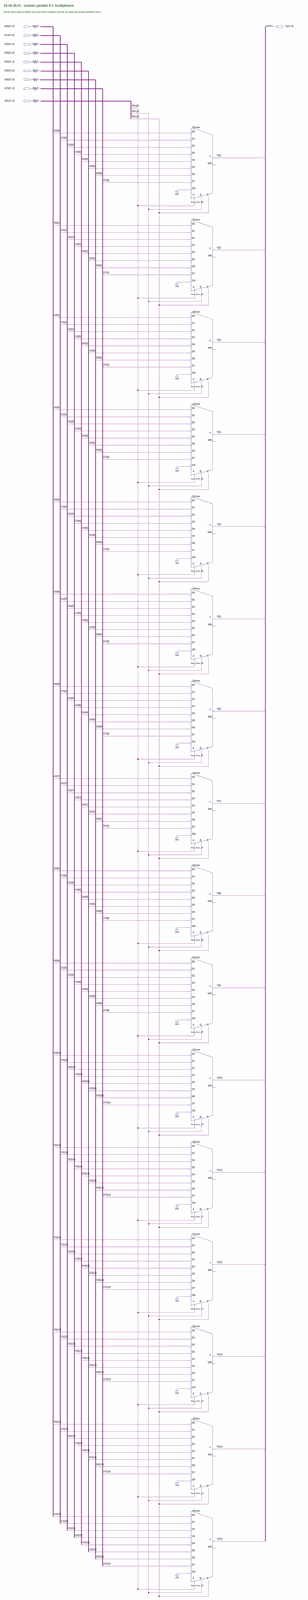
[diagram p0: schematic sheet, whole]
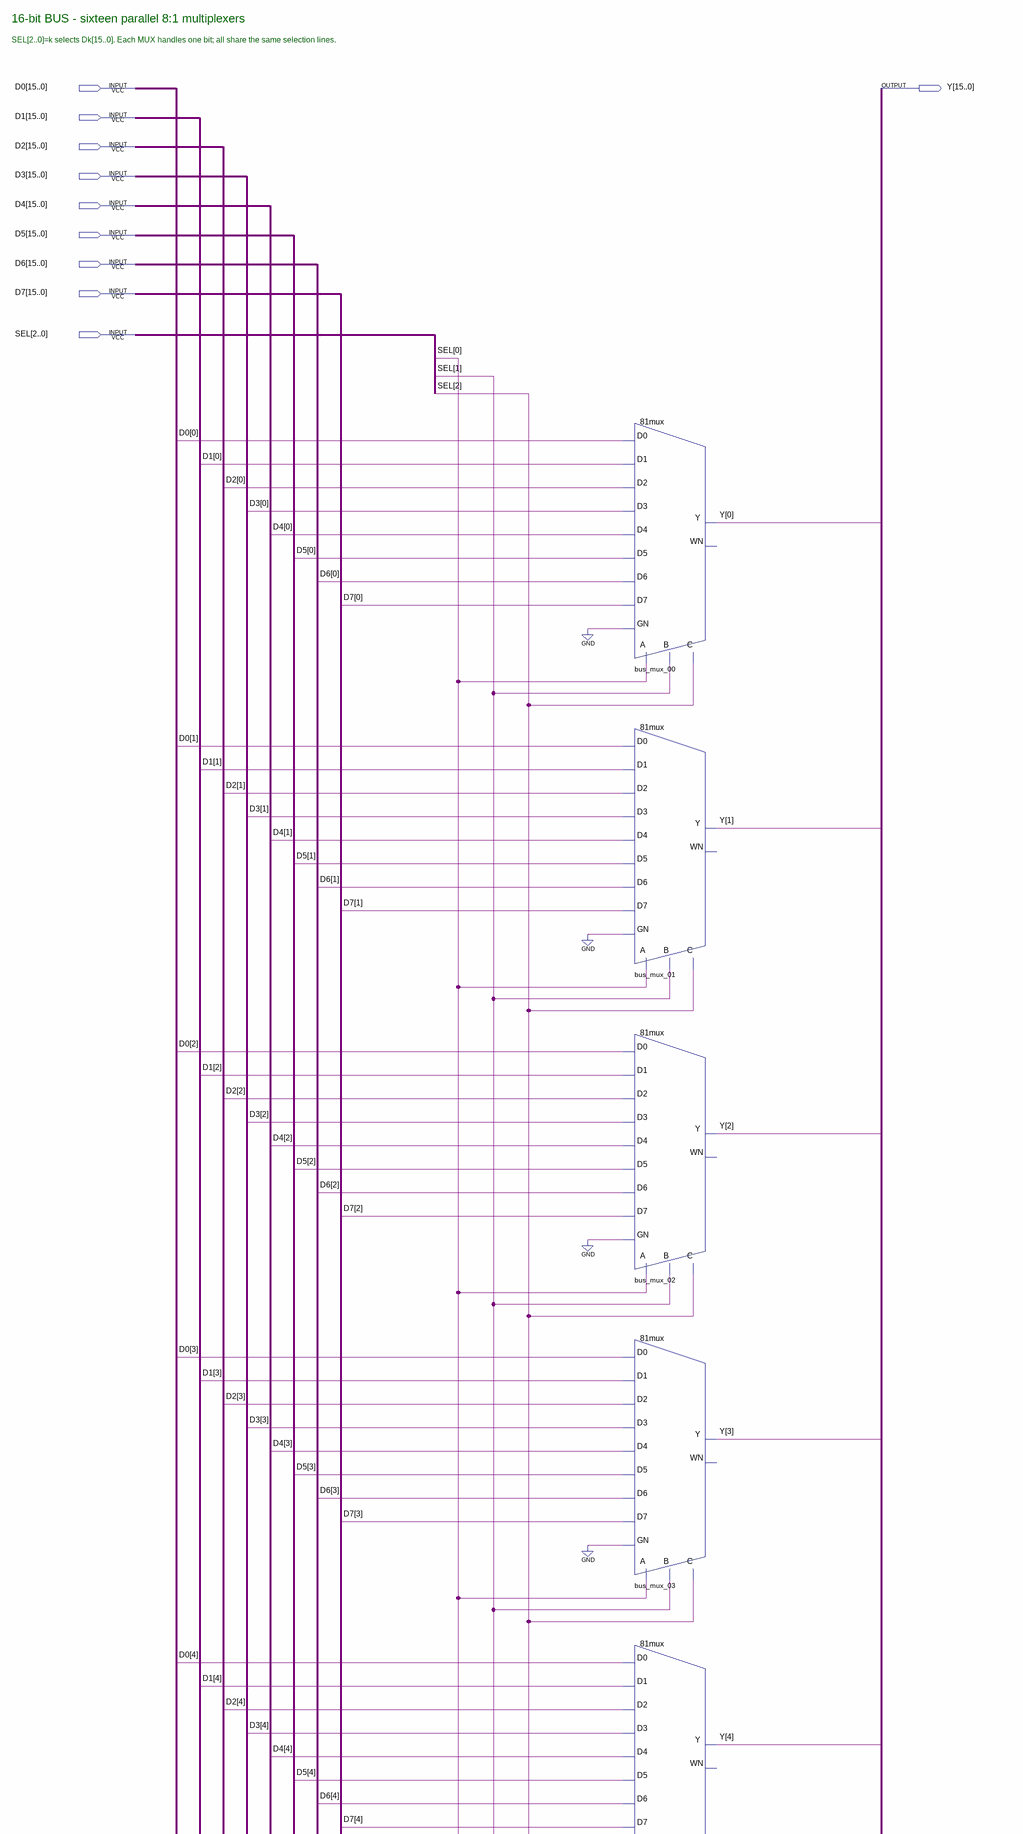
[diagram p1: schematic sheet, upper part]
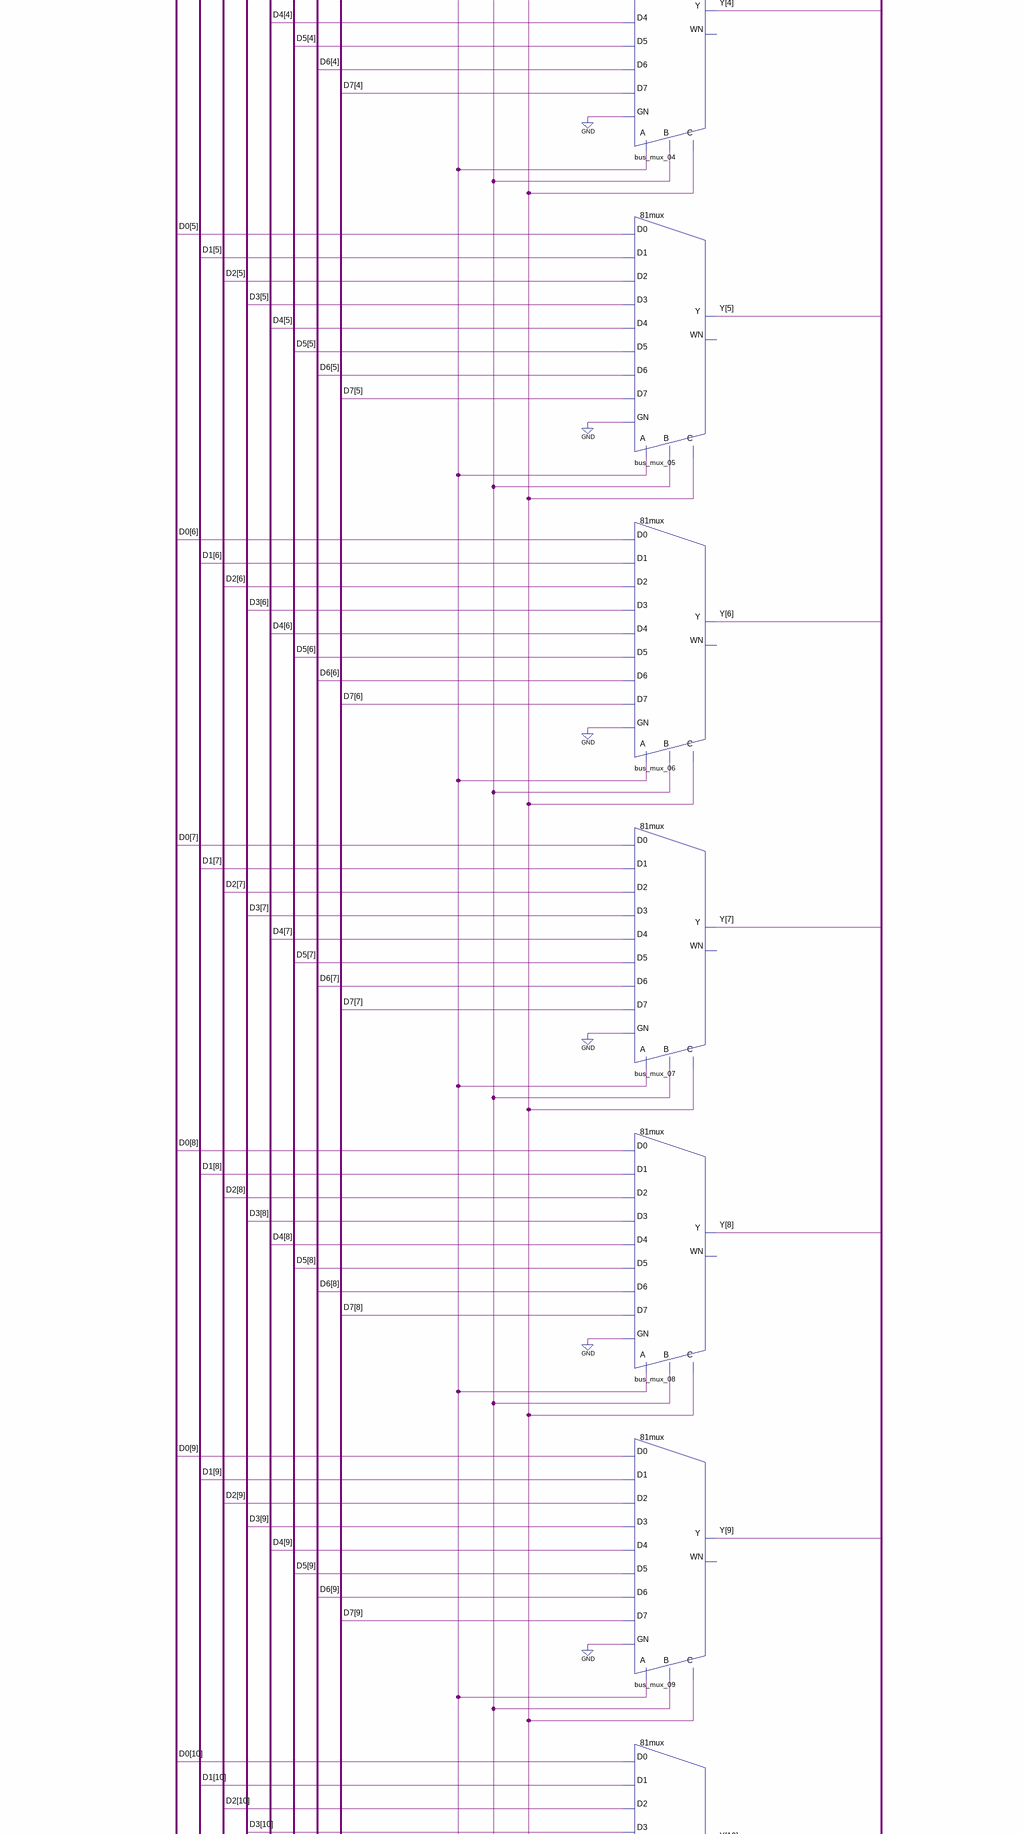
[diagram p2: schematic sheet, middle part]
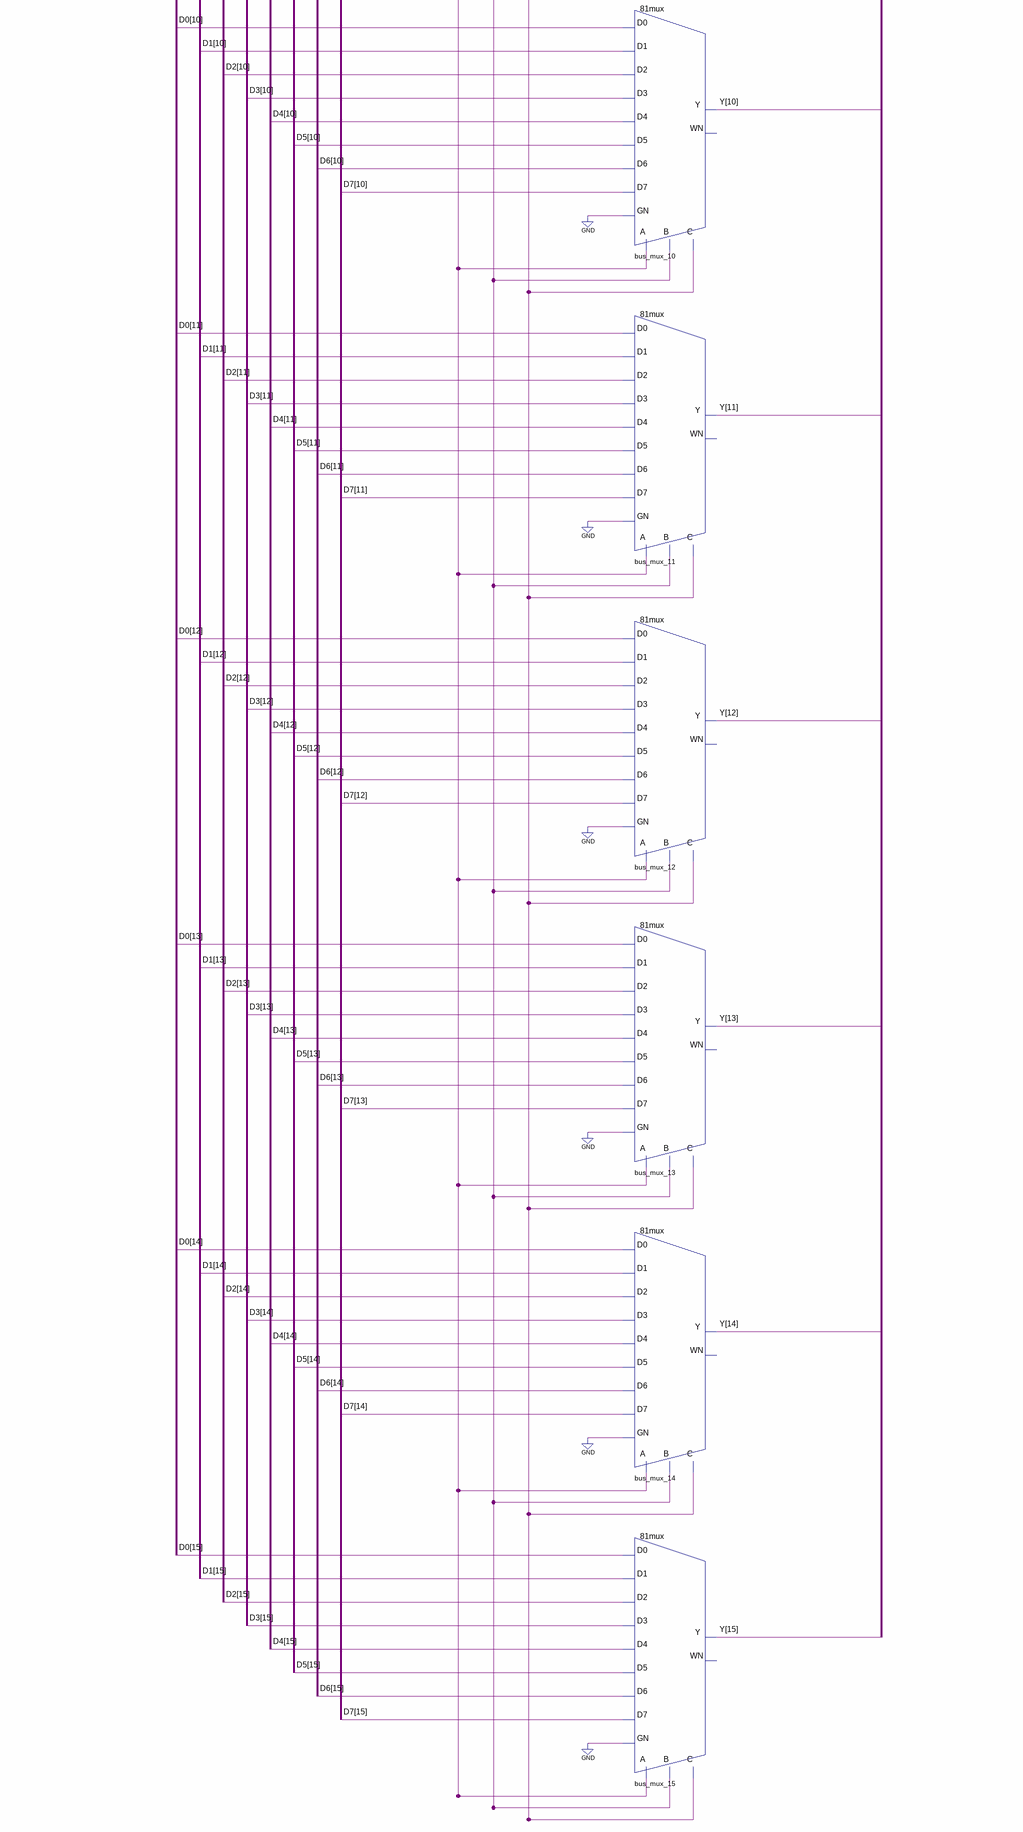
[diagram p3: schematic sheet, lower part]
// Quartus schematic bus16_mux8.bdf as structural Verilog: 16 symbols, 10 pins
module bus16_mux8 (
  input  [15:0] D0,
  input  [15:0] D1,
  input  [15:0] D2,
  input  [15:0] D3,
  input  [15:0] D4,
  input  [15:0] D5,
  input  [15:0] D6,
  input  [15:0] D7,
  input  [2:0] SEL,
  output [15:0] Y
);

  \81mux  bus_mux_00 (
    .D0(D0[0]), .D1(D1[0]), .D2(D2[0]), .D3(D3[0]), .D4(D4[0]), .D5(D5[0]), .D6(D6[0]), .D7(D7[0]),
    .GN(1'b0), .A(SEL[0]), .B(SEL[1]), .C(SEL[2]), .Y(Y[0]));  // open: WN
  \81mux  bus_mux_01 (
    .D0(D0[1]), .D1(D1[1]), .D2(D2[1]), .D3(D3[1]), .D4(D4[1]), .D5(D5[1]), .D6(D6[1]), .D7(D7[1]),
    .GN(1'b0), .A(SEL[0]), .B(SEL[1]), .C(SEL[2]), .Y(Y[1]));  // open: WN
  \81mux  bus_mux_02 (
    .D0(D0[2]), .D1(D1[2]), .D2(D2[2]), .D3(D3[2]), .D4(D4[2]), .D5(D5[2]), .D6(D6[2]), .D7(D7[2]),
    .GN(1'b0), .A(SEL[0]), .B(SEL[1]), .C(SEL[2]), .Y(Y[2]));  // open: WN
  \81mux  bus_mux_03 (
    .D0(D0[3]), .D1(D1[3]), .D2(D2[3]), .D3(D3[3]), .D4(D4[3]), .D5(D5[3]), .D6(D6[3]), .D7(D7[3]),
    .GN(1'b0), .A(SEL[0]), .B(SEL[1]), .C(SEL[2]), .Y(Y[3]));  // open: WN
  \81mux  bus_mux_04 (
    .D0(D0[4]), .D1(D1[4]), .D2(D2[4]), .D3(D3[4]), .D4(D4[4]), .D5(D5[4]), .D6(D6[4]), .D7(D7[4]),
    .GN(1'b0), .A(SEL[0]), .B(SEL[1]), .C(SEL[2]), .Y(Y[4]));  // open: WN
  \81mux  bus_mux_05 (
    .D0(D0[5]), .D1(D1[5]), .D2(D2[5]), .D3(D3[5]), .D4(D4[5]), .D5(D5[5]), .D6(D6[5]), .D7(D7[5]),
    .GN(1'b0), .A(SEL[0]), .B(SEL[1]), .C(SEL[2]), .Y(Y[5]));  // open: WN
  \81mux  bus_mux_06 (
    .D0(D0[6]), .D1(D1[6]), .D2(D2[6]), .D3(D3[6]), .D4(D4[6]), .D5(D5[6]), .D6(D6[6]), .D7(D7[6]),
    .GN(1'b0), .A(SEL[0]), .B(SEL[1]), .C(SEL[2]), .Y(Y[6]));  // open: WN
  \81mux  bus_mux_07 (
    .D0(D0[7]), .D1(D1[7]), .D2(D2[7]), .D3(D3[7]), .D4(D4[7]), .D5(D5[7]), .D6(D6[7]), .D7(D7[7]),
    .GN(1'b0), .A(SEL[0]), .B(SEL[1]), .C(SEL[2]), .Y(Y[7]));  // open: WN
  \81mux  bus_mux_08 (
    .D0(D0[8]), .D1(D1[8]), .D2(D2[8]), .D3(D3[8]), .D4(D4[8]), .D5(D5[8]), .D6(D6[8]), .D7(D7[8]),
    .GN(1'b0), .A(SEL[0]), .B(SEL[1]), .C(SEL[2]), .Y(Y[8]));  // open: WN
  \81mux  bus_mux_09 (
    .D0(D0[9]), .D1(D1[9]), .D2(D2[9]), .D3(D3[9]), .D4(D4[9]), .D5(D5[9]), .D6(D6[9]), .D7(D7[9]),
    .GN(1'b0), .A(SEL[0]), .B(SEL[1]), .C(SEL[2]), .Y(Y[9]));  // open: WN
  \81mux  bus_mux_10 (
    .D0(D0[10]), .D1(D1[10]), .D2(D2[10]), .D3(D3[10]), .D4(D4[10]), .D5(D5[10]), .D6(D6[10]), .D7(D7[10]),
    .GN(1'b0), .A(SEL[0]), .B(SEL[1]), .C(SEL[2]), .Y(Y[10]));  // open: WN
  \81mux  bus_mux_11 (
    .D0(D0[11]), .D1(D1[11]), .D2(D2[11]), .D3(D3[11]), .D4(D4[11]), .D5(D5[11]), .D6(D6[11]), .D7(D7[11]),
    .GN(1'b0), .A(SEL[0]), .B(SEL[1]), .C(SEL[2]), .Y(Y[11]));  // open: WN
  \81mux  bus_mux_12 (
    .D0(D0[12]), .D1(D1[12]), .D2(D2[12]), .D3(D3[12]), .D4(D4[12]), .D5(D5[12]), .D6(D6[12]), .D7(D7[12]),
    .GN(1'b0), .A(SEL[0]), .B(SEL[1]), .C(SEL[2]), .Y(Y[12]));  // open: WN
  \81mux  bus_mux_13 (
    .D0(D0[13]), .D1(D1[13]), .D2(D2[13]), .D3(D3[13]), .D4(D4[13]), .D5(D5[13]), .D6(D6[13]), .D7(D7[13]),
    .GN(1'b0), .A(SEL[0]), .B(SEL[1]), .C(SEL[2]), .Y(Y[13]));  // open: WN
  \81mux  bus_mux_14 (
    .D0(D0[14]), .D1(D1[14]), .D2(D2[14]), .D3(D3[14]), .D4(D4[14]), .D5(D5[14]), .D6(D6[14]), .D7(D7[14]),
    .GN(1'b0), .A(SEL[0]), .B(SEL[1]), .C(SEL[2]), .Y(Y[14]));  // open: WN
  \81mux  bus_mux_15 (
    .D0(D0[15]), .D1(D1[15]), .D2(D2[15]), .D3(D3[15]), .D4(D4[15]), .D5(D5[15]), .D6(D6[15]), .D7(D7[15]),
    .GN(1'b0), .A(SEL[0]), .B(SEL[1]), .C(SEL[2]), .Y(Y[15]));  // open: WN

  // Notes on the sheet:
  //   16-bit BUS - sixteen parallel 8:1 multiplexers
  //   SEL[2..0]=k selects Dk[15..0]. Each MUX handles one bit; all share the same selection lines.
endmodule
